# Altium schematic sheet 600_INV_N12V.SchDoc: CONVERTIDOR INVERSOR -12V
size A4; Date: 23/10/2026; DrawnBy: Santiago Londoño; SheetNumber: 6; SheetTotal: 8
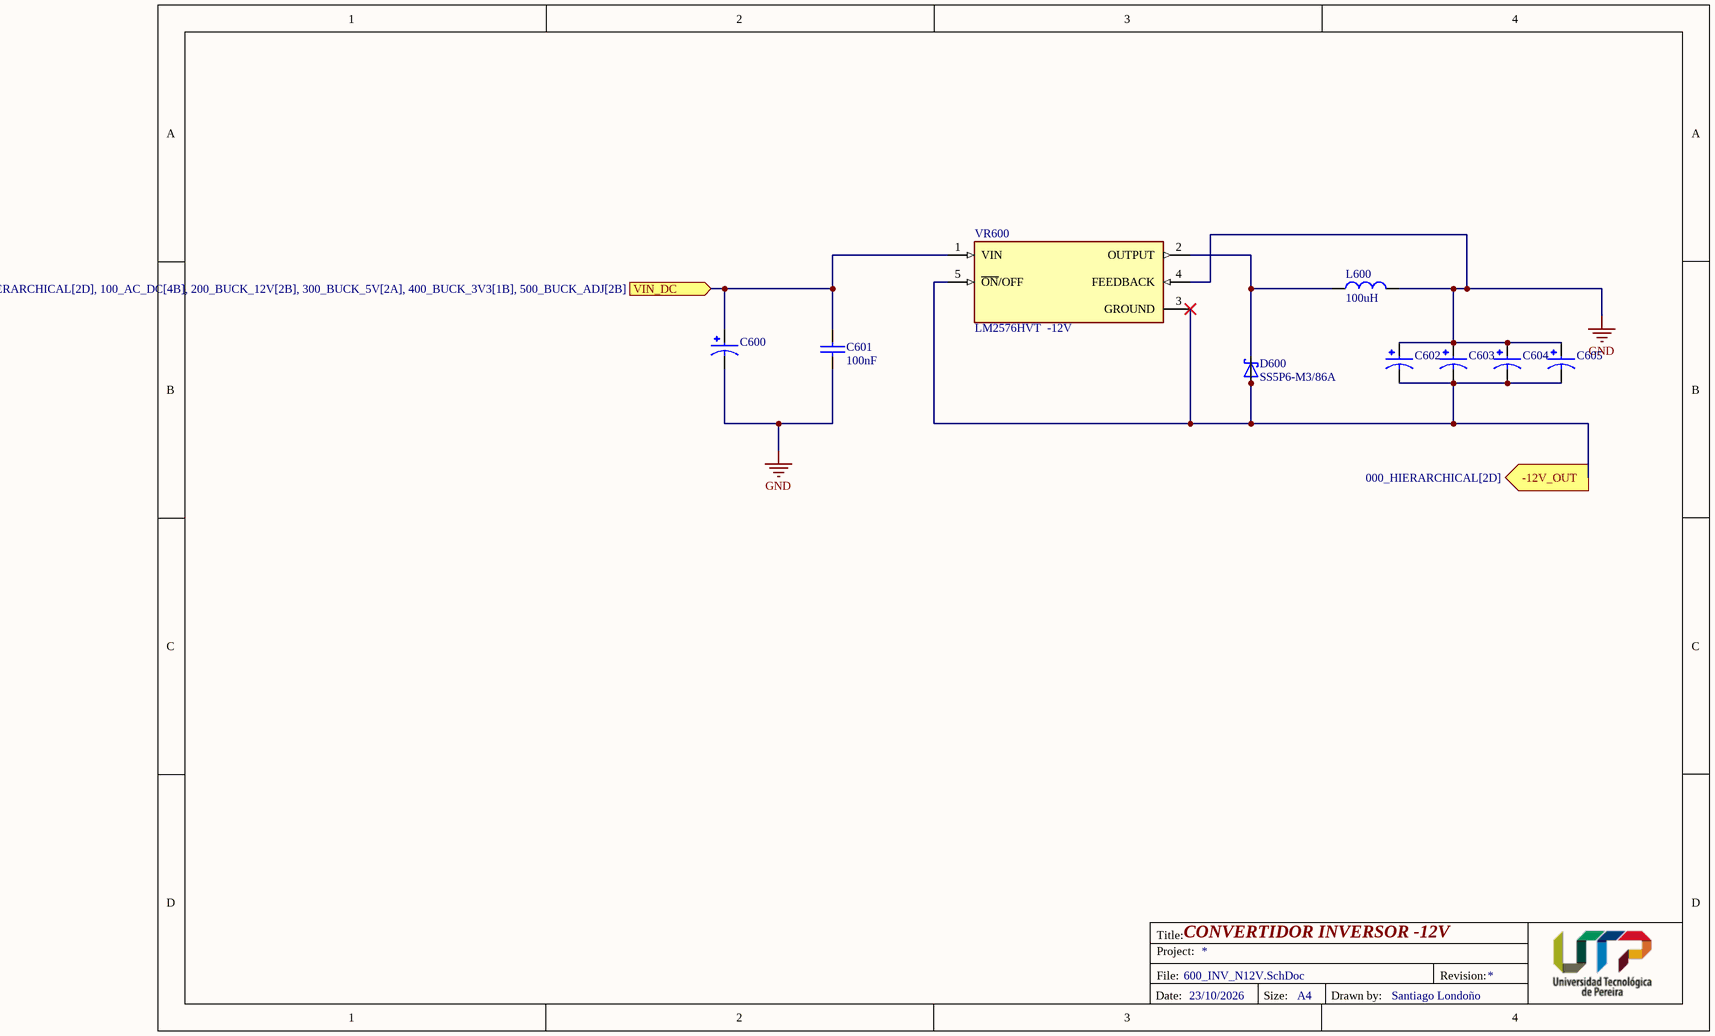
[diagram p0: 600_INV_N12V.SchDoc]

## Parts
C600  EEUFR1H561B  [CAPPRD500W60D1250H2500]  (value not drawn)
C601  value 100nF  [1206]  (hidden comment: 100nF 100V)
C602  EEUFR1V331U  [CAPPRD500W60D1000H1250]  (value not drawn)
C603  EEUFR1V331U  [CAPPRD500W60D1000H1250]  (value not drawn)
C604  EEUFR1V331U  [CAPPRD500W60D1000H1250]  (value not drawn)
C605  EEUFR1V331U  [CAPPRD500W60D1000H1250]  (value not drawn)
D600  SS5P6-M3/86A  [TO-277A(SMPC)]
L600  value 100uH  [L_2SMD_8x8.5x5MM_NS]  (hidden comment: 100uH 2.5A)
VR600  LM2576HVT  -12V  [TO170P1067X483X1651-5]

## Ports
-12V_OUT (out, see 000_HIERARCHICAL[2D]), VIN_DC (in, see 000_HIERARCHICAL[2D], 100_AC_DC[4B], 200_BUCK_12V[2B], 300_BUCK_5V[2A], 400_BUCK_3V3[1B], 500_BUCK_ADJ[2B])

## Nets
GND: C600.N C601.2 C602.P C603.P C604.P C605.P L600.2 VR600.4(FEEDBACK)
-12V_OUT: C602.N C603.N C604.N C605.N D600.A1(A) D600.A2(A__1) VR600.3(GROUND) VR600.5(~{ON}/OFF) ; port -12V_OUT
VIN_DC: C600.P C601.1 VR600.1(VIN) ; port VIN_DC
NetD600_K: D600.K(C) L600.1 VR600.2(OUTPUT)

## Notes on the sheet
- Title:
- Project:
- File:
- Revision:
- Date:
- Size:
- A4
- Drawn by:

## Library data of the parts
C600 = EEUFR1H561B: MF: {'manufacturer': u'Panasonic Electronic Components'}; Package: None; Price: None; Value: *; MP: EEUFR1H561B; Availability: Unavailable
C601 = Cap_0.1uF_1206_100V: CAP CER 0.1UF 100V X7R 1206; Manufacturer: Samsung Electro-Mechanics; Manufacturer Part Number: CL31B104KCFNNNE; Supplier 1: Digi-Key; Supplier Part Number 1: 1276-1151-1-ND; Last modified by: J.Jaramillo; Last modified date: 20240309; ComponentLink1Description: Digi-Key; ComponentLink1URL: https://www.digikey.com/en/products/detail/samsung-electro-mechanics/CL31B104KCFNNNE/3886809
C602-C605 = EEUFR1V331U: CAP ALUM 330UF 20% 35V RADIAL TH; MF: Panasonic; Check_prices: https://www.snapeda.com/parts/EEUFR1V331U/Panasonic/view-part/?ref=eda; Value: *; Purchase-URL: https://pricing.snapeda.com/search/part/EEUFR1V331U/?ref=eda; Price: None; MP: EEUFR1V331U; SnapEDA_Link: https://www.snapeda.com/parts/EEUFR1V331U/Panasonic/view-part/?ref=snap; Availability: In Stock; Package: RADIAL-2 Panasonic
D600 = SS5P6-M3/86A: Diode,Schottky Barrier,Vr 60V,If 5A,Pkg TO-277A,Vf 0.56V,Cj 200pF,Tj +150degc | General Semiconductor / Vishay SS5P6-M3/86A; MF: Vishay General Semiconductor; SnapEDA_Link: https://www.snapeda.com/parts/SS5P6-M3/86A/Vishay/view-part/?ref=snap; Package: TO-277 Vishay; Value: *; MP: SS5P6-M3/86A; Check_prices: https://www.snapeda.com/parts/SS5P6-M3/86A/Vishay/view-part/?ref=eda
L600 = L_100uH_2.5A_NS: 2.5A 100uH ±20% 3A SMD,8x8.5mm Power Inductors ROHS; Manufacturer: PROD Tech; Manufacturer Part Number: PSPMAA0805-101M-ANP; Supplier 1: LCSC; Supplier Part Number 1: C2962892; Reel Stock: N/A; Last modified by: J.Jaramillo; Last modified date: 20240310; ComponentLink1Description: Digi-Key; ComponentLink1URL: https://www.digikey.com/en/products/detail/bourns-inc/SRR1280-101M/2127044
VR600 = LM2576HVT-ADJ/NOPB: SIMPLE SWITCHERÂ® 4V to 60V, 3A Low Component Count Step-Down Regulator; MF: Texas Instruments; SnapEDA_Link: https://www.snapeda.com/parts/LM2576HVT-ADJ/NOPB/Texas+Instruments/view-part/?ref=snap; Package: TO-220-5 Texas Instruments; Value: *; MP: LM2576HVT-ADJ/NOPB; Check_prices: https://www.snapeda.com/parts/LM2576HVT-ADJ/NOPB/Texas+Instruments/view-part/?ref=eda